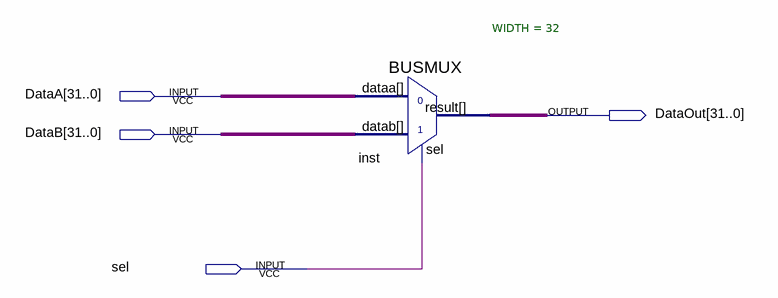
[diagram p0: schematic sheet]
// Quartus schematic MUX32bit.bdf as structural Verilog: 1 symbols, 4 pins
module MUX32bit (
  input  [31:0] DataA,
  input  [31:0] DataB,
  input  sel,
  output [31:0] DataOut
);

  BUSMUX #(.WIDTH(32)) inst (.datab(DataB), .sel(sel), .dataa(DataA), .result(DataOut));
endmodule
